# Altium schematic sheet MPU - GND.SchDoc
size A4; SheetNumber: 2; SheetTotal: 4
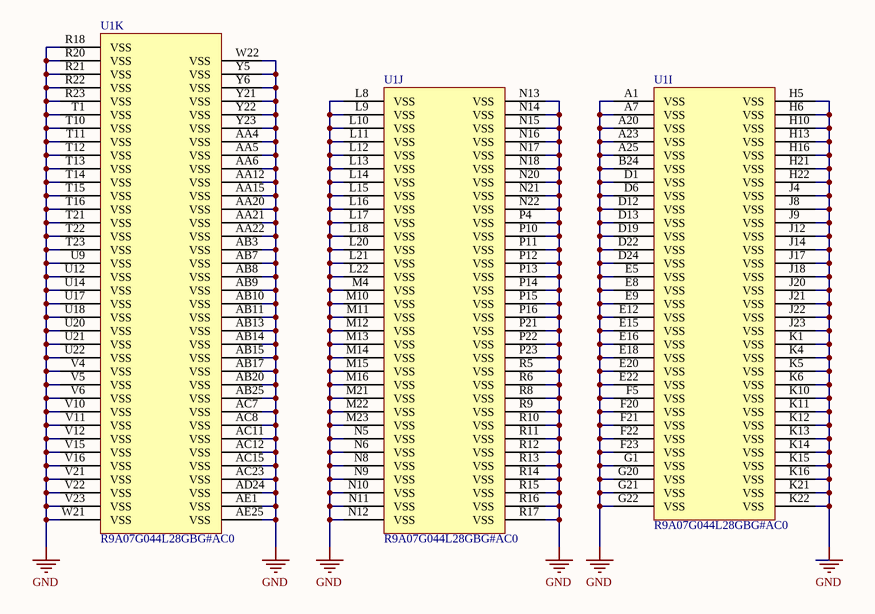
[diagram p0: MPU - GND.SchDoc]

## Parts
U1  R9A07G044L28GBG#AC0  [R9A07G044L28GBG#AC0]  (parts I,J,K of 11)

## Nets
GND: U1.A1(VSS) U1.A7(VSS) U1.A20(VSS) U1.A23(VSS) U1.A25(VSS) U1.AA4(VSS) U1.AA5(VSS) U1.AA6(VSS) U1.AA12(VSS) U1.AA15(VSS) U1.AA20(VSS) U1.AA21(VSS) U1.AA22(VSS) U1.AB3(VSS) U1.AB7(VSS) U1.AB8(VSS) U1.AB9(VSS) U1.AB10(VSS) U1.AB11(VSS) U1.AB13(VSS) U1.AB14(VSS) U1.AB15(VSS) U1.AB17(VSS) U1.AB20(VSS) U1.AB25(VSS) U1.AC7(VSS) U1.AC8(VSS) U1.AC11(VSS) U1.AC12(VSS) U1.AC15(VSS) U1.AC23(VSS) U1.AD24(VSS) U1.AE1(VSS) U1.AE25(VSS) U1.B24(VSS) U1.D1(VSS) U1.D6(VSS) U1.D12(VSS) U1.D13(VSS) U1.D19(VSS) U1.D22(VSS) U1.D24(VSS) U1.E5(VSS) U1.E8(VSS) U1.E9(VSS) U1.E12(VSS) U1.E15(VSS) U1.E16(VSS) U1.E18(VSS) U1.E20(VSS) U1.E22(VSS) U1.F5(VSS) U1.F20(VSS) U1.F21(VSS) U1.F22(VSS) U1.F23(VSS) U1.G1(VSS) U1.G20(VSS) U1.G21(VSS) U1.G22(VSS) U1.H5(VSS) U1.H6(VSS) U1.H10(VSS) U1.H13(VSS) U1.H16(VSS) U1.H21(VSS) U1.H22(VSS) U1.J4(VSS) U1.J8(VSS) U1.J9(VSS) U1.J12(VSS) U1.J14(VSS) U1.J17(VSS) U1.J18(VSS) U1.J20(VSS) U1.J21(VSS) U1.J22(VSS) U1.J23(VSS) U1.K1(VSS) U1.K4(VSS) U1.K5(VSS) U1.K6(VSS) U1.K10(VSS) U1.K11(VSS) U1.K12(VSS) U1.K13(VSS) U1.K14(VSS) U1.K15(VSS) U1.K16(VSS) U1.K21(VSS) U1.K22(VSS) U1.L8(VSS) U1.L9(VSS) U1.L10(VSS) U1.L11(VSS) U1.L12(VSS) U1.L13(VSS) U1.L14(VSS) U1.L15(VSS) U1.L16(VSS) U1.L17(VSS) U1.L18(VSS) U1.L20(VSS) U1.L21(VSS) U1.L22(VSS) U1.M4(VSS) U1.M10(VSS) U1.M11(VSS) U1.M12(VSS) U1.M13(VSS) U1.M14(VSS) U1.M15(VSS) U1.M16(VSS) U1.M21(VSS) U1.M22(VSS) U1.M23(VSS) U1.N5(VSS) U1.N6(VSS) U1.N8(VSS) U1.N9(VSS) U1.N10(VSS) U1.N11(VSS) U1.N12(VSS) U1.N13(VSS) U1.N14(VSS) U1.N15(VSS) U1.N16(VSS) U1.N17(VSS) U1.N18(VSS) U1.N20(VSS) U1.N21(VSS) U1.N22(VSS) U1.P4(VSS) U1.P10(VSS) U1.P11(VSS) U1.P12(VSS) U1.P13(VSS) U1.P14(VSS) U1.P15(VSS) U1.P16(VSS) U1.P21(VSS) U1.P22(VSS) U1.P23(VSS) U1.R5(VSS) U1.R6(VSS) U1.R8(VSS) U1.R9(VSS) U1.R10(VSS) U1.R11(VSS) U1.R12(VSS) U1.R13(VSS) U1.R14(VSS) U1.R15(VSS) U1.R16(VSS) U1.R17(VSS) U1.R18(VSS) U1.R20(VSS) U1.R21(VSS) U1.R22(VSS) U1.R23(VSS) U1.T1(VSS) U1.T10(VSS) U1.T11(VSS) U1.T12(VSS) U1.T13(VSS) U1.T14(VSS) U1.T15(VSS) U1.T16(VSS) U1.T21(VSS) U1.T22(VSS) U1.T23(VSS) U1.U9(VSS) U1.U12(VSS) U1.U14(VSS) U1.U17(VSS) U1.U18(VSS) U1.U20(VSS) U1.U21(VSS) U1.U22(VSS) U1.V4(VSS) U1.V5(VSS) U1.V6(VSS) U1.V10(VSS) U1.V11(VSS) U1.V12(VSS) U1.V15(VSS) U1.V16(VSS) U1.V21(VSS) U1.V22(VSS) U1.V23(VSS) U1.W21(VSS) U1.W22(VSS) U1.Y5(VSS) U1.Y6(VSS) U1.Y21(VSS) U1.Y22(VSS) U1.Y23(VSS)

## Library data of the parts
U1 = R9A07G044L28GBG#AC0: MPU RZ/G2L ARM Cortex-A55+/ARM Cortex-M33 RISC 64-Bit 1.2GHz 1.8V/3.3V 551-Pin BGA; Manufacturer Lifecycle Status: ACTIVE; Pitch: 800µm; Max Supply Voltage: 3.63V; Min Supply Voltage: 2.97V; RAM Size: 128kB; Number of USB Channels: 2; ComponentLink2Description: Datasheet URL; Mount: Surface Mount; ComponentLink2URL: https://octopart.com/cad-content/api/get-model-datasheet/15189/122020395; Height: 1.4mm; Export Control Classification Number (ECCN) Code: 3A991; Frequency: 1.2GHz; Max Frequency: 1.2GHz; ComponentLink1URL: http://www.renesas.com; Case/Package: BGA; Length: 21mm; Lifecycle Status: Production; ComponentLink3Description: Manufacturer's Package Drawing; Width: 21mm; China RoHS: Compliant; ComponentLink1Description: Manufacturer's Website; HelpURL: https://octopart.com/cad-content/api/get-model-datasheet/15189/122020395; RoHS: Compliant; Number of Pins: 551; ComponentLink3URL: https://www.renesas.com/en/document/psc/package-drawing-lfbga-551pin-plbg0551ga